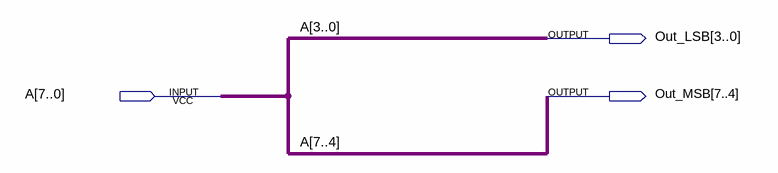
[diagram p0: schematic sheet]
// Quartus schematic 8_to_4_bus.bdf as structural Verilog: 0 symbols, 3 pins
module \8_to_4_bus  (
  input  [7:0] A,
  output [3:0] Out_LSB,
  output [7:4] Out_MSB
);


  assign Out_LSB = A[3:0];
  assign Out_MSB = A[7:4];
endmodule
